# Altium schematic sheet BMC096C.schdoc (part 3 of 3)
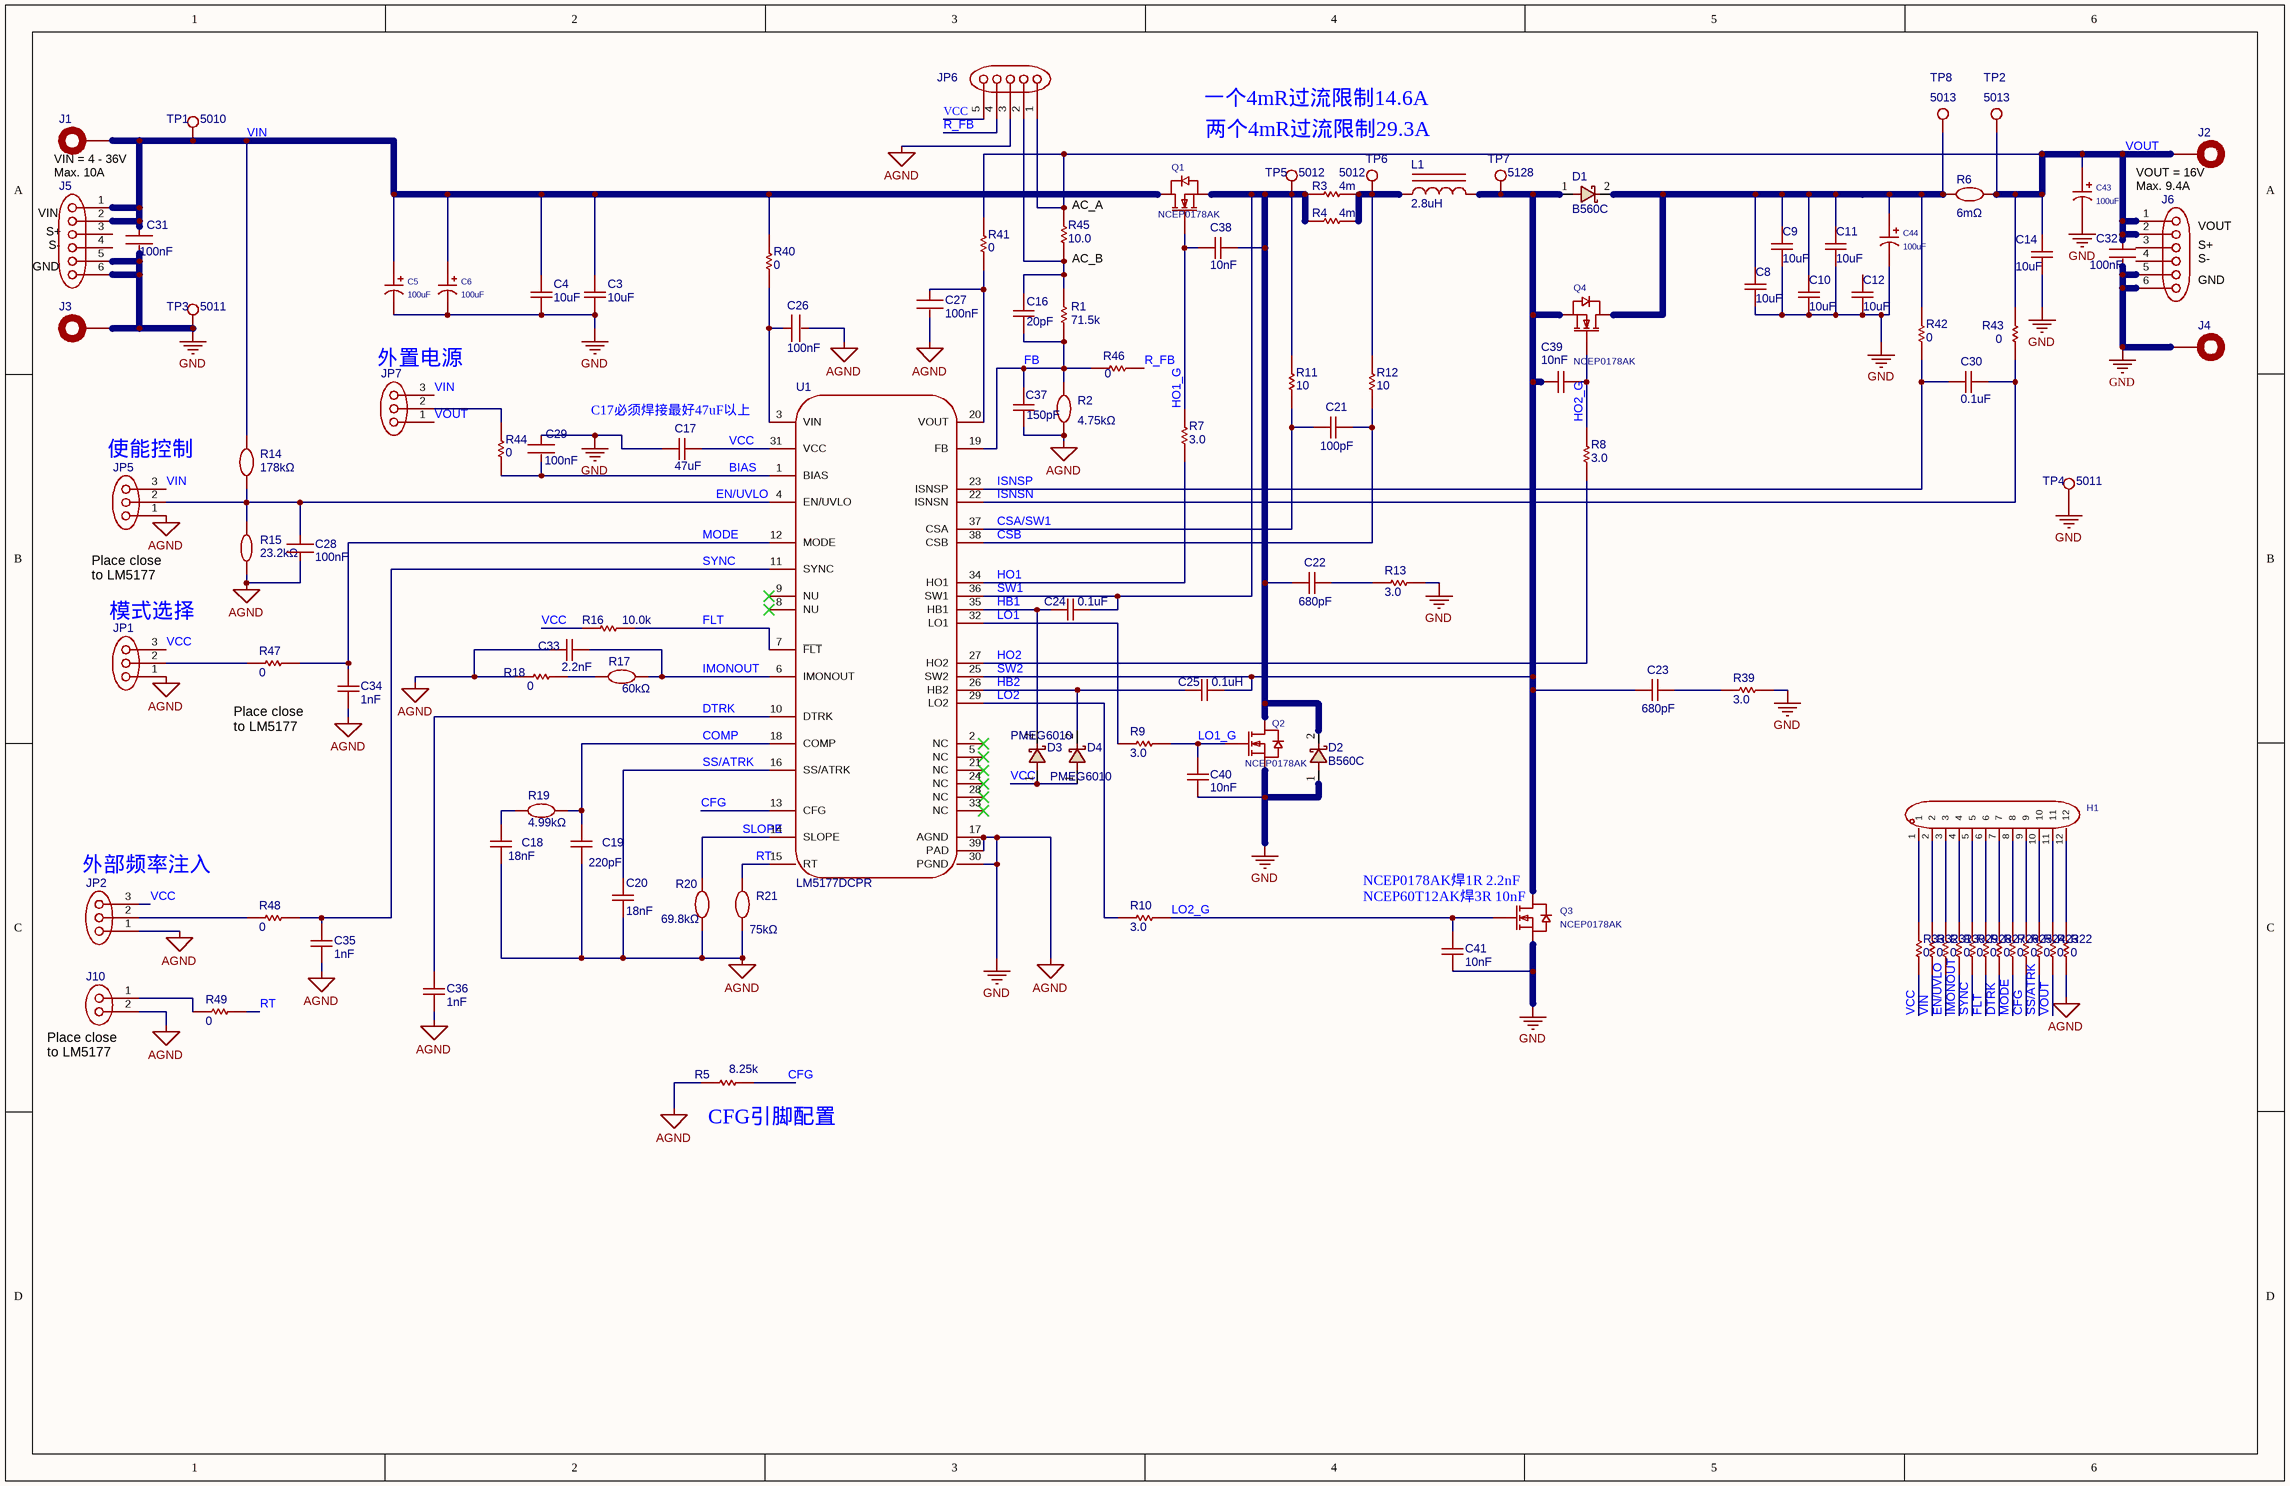
[diagram p2: BMC096C.schdoc]

## Library data of the parts (continued)
R2 = ERJ3EKF4751V: 电阻类型:厚膜电阻;阻值:4.75kΩ;精度:±1%;功率:100mW;工作电压:75V;温度系数:±100ppm/℃;; Manufacturer: PANASONIC(松下); Add into BOM: yes; 3D Model: fc143cca1e79419f9cd78b61e9279f08; 3D Model Transform: 31.8897,63.7794,0,90,0,0,0,0,0; Tolerance: ±1%; Power(Watts): 100mW; Voltage-Supply(Max): 75V; ModelName: R0603; Symbol: ERJ3EKF4751V; Device: ERJ3EKF4751V; Convert to PCB: yes; Value: 4.75kΩ; LCSC Part Name: 厚膜电阻 4.75kΩ ±1% 100mW; Supplier Part: C403242; Manufacturer Part: ERJ3EKF4751V; Supplier Footprint: 0603; JLCPCB Part Class: Extended Part; Datasheet: https://item.szlcsc.com/datasheet/ERJ3EKF4751V/389041.html; Supplier: LCSC; Type: 厚膜电阻; Temperature Coefficient: ±100ppm/℃; Operating Temperature: -55℃~+155℃; FootprintName: R0603
R3 = CMP-0090660-1: 4 mOhms -1% 1W Chip Resistor Wide 0805 (2012 Metric), 0508 Automotive AEC-Q200, Current Sense Metal Foil; Manufacturer: Susumu; AEC Grade: Grade 0; TempCo: 50ppm/癈; SizeZ_mm: 0.7mm; AEC Qualified: Yes; Tolerance_%: 1%; Origin Footprint: FP-KRL2012E-M-R004-F-T5_2012-IPC_C; OriginFootprint 2: FP-KRL2012E-M-R004-F-T5_2012-IPC_B; OriginFootprint 3: FP-KRL2012E-M-R004-F-T5_2012-IPC_A; UniqueId: fe89d0632cfce75f; OriginModelName: Res_KRL2012E-M-R004-F-T5_2012; Device: CMP-0090660-1; Symbol: CMP-0090660-1; Supplier 1: Digikey; ComponentLink1URL: https://www.susumu.co.jp/common/pdf/n_catalog_partition19_en.pdf?v=20180406; Series: KRL; Supplier Part Number 1: 408-1594-1-ND; ComponentLink1Description: Datasheet; RoHS: TRUE; PartNumber: KRL2012E-M-R004-F-T5; Datasheet Path: datasheets/Res-KRL2012E-M-R004-F-T5.pdf; Digikey Description: RES 0.004 OHM 1W 0805 WIDE; Part Number: KRL2012E-M-R004-F-T5; Supplier 2: Mouser; datasheet: https://www.susumu.co.jp/common/pdf/n_catalog_partition19_en.pdf?v=20180406; Supplier Part Number 2: 754-KRL2012EMR004FT5; helpURL: https://upverter.com/upn/revision/b6c0b371fcd2c6f4/; Mouser Description: Current Sense Resistors 0805(Long Side 0508) 1.0W 0.004 Ohm 1% 50Ppm; Lead Free: Yes; Operating Temperature Range: -55癈 to +155癈; Technology: Metal Foil; Digikey Part Number: 408-1594-1-ND; Res_ohm: 4m; PackageReference: 2012; Mouser Part Number: 754-KRL2012EMR004FT5; Power_W: 1W; DesignItemID: CMP-0090660-1; LibraryName: Altium Vault - TI; FootprintName: FP-KRL2012E-M-R004-F-T5_2012-MFG; AddInBom: yes
R4 = CMP-0090660-1: 4 mOhms -1% 1W Chip Resistor Wide 0805 (2012 Metric), 0508 Automotive AEC-Q200, Current Sense Metal Foil; Manufacturer: Susumu; AEC Grade: Grade 0; TempCo: 50ppm/癈; SizeZ_mm: 0.7mm; AEC Qualified: Yes; Tolerance_%: 1%; Origin Footprint: FP-KRL2012E-M-R004-F-T5_2012-IPC_C; OriginFootprint 2: FP-KRL2012E-M-R004-F-T5_2012-IPC_B; OriginFootprint 3: FP-KRL2012E-M-R004-F-T5_2012-IPC_A; UniqueId: fdc86a4b576d9e98; OriginModelName: Res_KRL2012E-M-R004-F-T5_2012; Device: CMP-0090660-1; Symbol: CMP-0090660-1; Supplier 1: Digikey; ComponentLink1URL: https://www.susumu.co.jp/common/pdf/n_catalog_partition19_en.pdf?v=20180406; Series: KRL; Supplier Part Number 1: 408-1594-1-ND; ComponentLink1Description: Datasheet; RoHS: TRUE; PartNumber: KRL2012E-M-R004-F-T5; Datasheet Path: datasheets/Res-KRL2012E-M-R004-F-T5.pdf; Digikey Description: RES 0.004 OHM 1W 0805 WIDE; Part Number: KRL2012E-M-R004-F-T5; Supplier 2: Mouser; datasheet: https://www.susumu.co.jp/common/pdf/n_catalog_partition19_en.pdf?v=20180406; Supplier Part Number 2: 754-KRL2012EMR004FT5; helpURL: https://upverter.com/upn/revision/b6c0b371fcd2c6f4/; Mouser Description: Current Sense Resistors 0805(Long Side 0508) 1.0W 0.004 Ohm 1% 50Ppm; Lead Free: Yes; Operating Temperature Range: -55癈 to +155癈; Technology: Metal Foil; Digikey Part Number: 408-1594-1-ND; Res_ohm: 4m; PackageReference: 2012; Mouser Part Number: 754-KRL2012EMR004FT5; Power_W: 1W; DesignItemID: CMP-0090660-1; LibraryName: Altium Vault - TI; FootprintName: FP-KRL2012E-M-R004-F-T5_2012-MFG; AddInBom: yes
R5 = CMP-0023307-5: RES, 8.25 k, 1%, 0.1 W, 0603; Manufacturer: Yageo; Power_W: 100mW; TempCo: 100 ppm/C; Value_Code: 8k25; Value: 8.25k; EIA_Code: E96; SizeX_mm: 1.6; SizeY_mm: 0.8; SizeZ_mm: 1; Value2: 0.1W; SizeArea_mm2: 1.28; CompType: Resistor; AEC Qualified: N; VDC_V: 75V; AEC Category: Q200; SizeAreaWB_mm2: 4.68; Origin Footprint: 0603; OriginFootprint 2: 0603_HV; OriginFootprint 3: 0603L; OriginFootprint 4: 0603M; AddInBom: yes; Symbol: CMP-0023307-5; Device: CMP-0023307-5; Supplier Part Number 2: 603-RC0603FR-078K25L; Supplier 2: Mouser; Supplier Part Number 3: 9238590; Supplier 3: Farnell; RoHS: Y; Value1: 1%; MountType: SMT; Supplier 1: Digi-Key; PackageReference: 0603; Tolerance_%: 1%; Res_ohm: 8.25k; PartNumber: RC0603FR-078K25L; ComponentLink1Description: Datasheet link; Supplier Part Number 1: 311-8.25KHRCT-ND; Technology: Thick Film; ComponentLink1URL: http://www.yageo.com/pdf/Pu-RC0603_51_PbFree_L_2.pdf; AEC Grade: N/A; DesignItemID: CMP-0023307-5; LibraryName: Altium Vault - TI; FootprintName: 0603S
R6 = JER2512F3R006: 电阻类型:采样电阻；合金电阻;阻值:6mΩ;精度:±1%;功率:3W;温度系数:±50ppm/℃;安装方式:贴片;; Manufacturer: JIERR(捷而瑞); Add into BOM: yes; 3D Model: 3c946b39f1b547de9af067cb1ede82cc; 3D Model Transform: 252.7554,126.7714,0,0,0,0,0,0,0; Tolerance: ±1%; Power(Watts): 3W; ModelName: RES-SMD_L6.4-W3.2-R2512; Symbol: JER2512F3R006; Device: JER2512F3R006; Convert to PCB: yes; Value: 6mΩ; LCSC Part Name: 6mΩ 3W 2512 ±1%; Supplier Part: C46634449; Manufacturer Part: JER2512F3R006; Supplier Footprint: 2512; JLCPCB Part Class: Extended Part; Datasheet: https://item.szlcsc.com/datasheet/JER2512F3R006/48788251.html; Supplier: LCSC; Type: 采样电阻；合金电阻; Temperature Coefficient: ±50ppm/℃; Mounting Type: 贴片; FootprintName: RES-SMD_L6.4-W3.2-R2512
R7 = CMP-0025804-4: RES, 3.0, 5%, 0.1 W, AEC-Q200 Grade 0, 0603; Manufacturer: Vishay-Dale; Power_W: 100mW; TempCo: 200 ppm/C; Value_Code: 3R00; Value: 3.0; EIA_Code: E24; Res_ohm: 3; SizeX_mm: 1.6; SizeY_mm: 0.8; SizeZ_mm: 1; Value2: 0.1W; SizeArea_mm2: 1.28; CompType: Resistor; AEC Qualified: Y; VDC_V: 75V; AEC Category: Q200; AEC Grade: 0; Origin Footprint: 0603; OriginFootprint 2: 0603_HV; OriginFootprint 3: 0603L; OriginFootprint 4: 0603M; UniqueId: ba2c6d155e7fd301; AddInBom: yes; Device: CMP-0025804-4; Symbol: CMP-0025804-4; Supplier Part Number 2: 47P3561; Supplier 2: Newark; Supplier Part Number 3: 71-CRCW0603J-3-E3; Supplier 3: Mouser; RoHS: E; Value1: 5%; MountType: SMT; Supplier 1: Digi-Key; PackageReference: 0603; Tolerance_%: 5%; PartNumber: CRCW06033R00JNEA; ComponentLink1Description: Datasheet link; Supplier Part Number 1: 541-3.0GCT-ND; Technology: Thick Film; ComponentLink1URL: http://www.vishay.com/docs/20035/dcrcwe3.pdf; DesignItemID: CMP-0025804-4; LibraryName: Altium Vault - TI; FootprintName: 0603S
R8 = CMP-0025804-4: RES, 3.0, 5%, 0.1 W, AEC-Q200 Grade 0, 0603; Manufacturer: Vishay-Dale; Power_W: 100mW; TempCo: 200 ppm/C; Value_Code: 3R00; Value: 3.0; EIA_Code: E24; Res_ohm: 3; SizeX_mm: 1.6; SizeY_mm: 0.8; SizeZ_mm: 1; Value2: 0.1W; SizeArea_mm2: 1.28; CompType: Resistor; AEC Qualified: Y; VDC_V: 75V; AEC Category: Q200; AEC Grade: 0; Origin Footprint: 0603; OriginFootprint 2: 0603_HV; OriginFootprint 3: 0603L; OriginFootprint 4: 0603M; UniqueId: 86d447fa2a9c8586; AddInBom: yes; Device: CMP-0025804-4; Symbol: CMP-0025804-4; Supplier Part Number 2: 47P3561; Supplier 2: Newark; Supplier Part Number 3: 71-CRCW0603J-3-E3; Supplier 3: Mouser; RoHS: E; Value1: 5%; MountType: SMT; Supplier 1: Digi-Key; PackageReference: 0603; Tolerance_%: 5%; PartNumber: CRCW06033R00JNEA; ComponentLink1Description: Datasheet link; Supplier Part Number 1: 541-3.0GCT-ND; Technology: Thick Film; ComponentLink1URL: http://www.vishay.com/docs/20035/dcrcwe3.pdf; DesignItemID: CMP-0025804-4; LibraryName: Altium Vault - TI; FootprintName: 0603S
R9 = CMP-0025804-4: RES, 3.0, 5%, 0.1 W, AEC-Q200 Grade 0, 0603; Manufacturer: Vishay-Dale; Power_W: 100mW; TempCo: 200 ppm/C; Value_Code: 3R00; Value: 3.0; EIA_Code: E24; Res_ohm: 3; SizeX_mm: 1.6; SizeY_mm: 0.8; SizeZ_mm: 1; Value2: 0.1W; SizeArea_mm2: 1.28; CompType: Resistor; AEC Qualified: Y; VDC_V: 75V; AEC Category: Q200; AEC Grade: 0; Origin Footprint: 0603; OriginFootprint 2: 0603_HV; OriginFootprint 3: 0603L; OriginFootprint 4: 0603M; UniqueId: 1e1ffada38203b9e; AddInBom: yes; Device: CMP-0025804-4; Symbol: CMP-0025804-4; Supplier Part Number 2: 47P3561; Supplier 2: Newark; Supplier Part Number 3: 71-CRCW0603J-3-E3; Supplier 3: Mouser; RoHS: E; Value1: 5%; MountType: SMT; Supplier 1: Digi-Key; PackageReference: 0603; Tolerance_%: 5%; PartNumber: CRCW06033R00JNEA; ComponentLink1Description: Datasheet link; Supplier Part Number 1: 541-3.0GCT-ND; Technology: Thick Film; ComponentLink1URL: http://www.vishay.com/docs/20035/dcrcwe3.pdf; DesignItemID: CMP-0025804-4; LibraryName: Altium Vault - TI; FootprintName: 0603S
R10 = CMP-0025804-4: RES, 3.0, 5%, 0.1 W, AEC-Q200 Grade 0, 0603; Manufacturer: Vishay-Dale; Power_W: 100mW; TempCo: 200 ppm/C; Value_Code: 3R00; Value: 3.0; EIA_Code: E24; Res_ohm: 3; SizeX_mm: 1.6; SizeY_mm: 0.8; SizeZ_mm: 1; Value2: 0.1W; SizeArea_mm2: 1.28; CompType: Resistor; AEC Qualified: Y; VDC_V: 75V; AEC Category: Q200; AEC Grade: 0; Origin Footprint: 0603; OriginFootprint 2: 0603_HV; OriginFootprint 3: 0603L; OriginFootprint 4: 0603M; UniqueId: 41bc0941336b1513; AddInBom: yes; Device: CMP-0025804-4; Symbol: CMP-0025804-4; Supplier Part Number 2: 47P3561; Supplier 2: Newark; Supplier Part Number 3: 71-CRCW0603J-3-E3; Supplier 3: Mouser; RoHS: E; Value1: 5%; MountType: SMT; Supplier 1: Digi-Key; PackageReference: 0603; Tolerance_%: 5%; PartNumber: CRCW06033R00JNEA; ComponentLink1Description: Datasheet link; Supplier Part Number 1: 541-3.0GCT-ND; Technology: Thick Film; ComponentLink1URL: http://www.vishay.com/docs/20035/dcrcwe3.pdf; DesignItemID: CMP-0025804-4; LibraryName: Altium Vault - TI; FootprintName: 0603S
R11 = CMP-0084243-1: RES, 100, 1%, 0.25 W, AEC-Q200 Grade 0, 0603; Manufacturer: Vishay-Dale; Power_W: 250mW; TempCo: 100 ppm/C; SizeAreaWB_mm2: 4.68; Value_Code: 100R; Value: 100; EIA_Code: E96; SizeX_mm: 1.6; SizeY_mm: 0.8; SizeZ_mm: 1; Value2: 0.25W; SizeArea_mm2: 1.28; CompType: Resistor; AEC Qualified: Y; AEC Grade: 0; AEC Category: Q200; Origin Footprint: 0603; OriginFootprint 2: 0603M; OriginFootprint 3: 0603L; OriginFootprint 4: 0603_HV; UniqueId: 763cf8d5648cb4fd; AddInBom: yes; Device: CMP-0084243-1; Symbol: CMP-0084243-1; ComponentLink1URL: http://www.vishay.com/docs/20043/crcwhpe3.pdf; RoHS: Y; Value1: 1%; MountType: SMT; PackageReference: 0603; Tolerance_%: 1%; Res_ohm: 100; PartNumber: CRCW0603100RFKEAHP; ComponentLink1Description: Datasheet link; Technology: Thick Film; DesignItemID: CMP-0084243-1; LibraryName: Altium Vault - TI; FootprintName: 0603S
R12 = CMP-0084243-1: RES, 100, 1%, 0.25 W, AEC-Q200 Grade 0, 0603; Manufacturer: Vishay-Dale; Power_W: 250mW; TempCo: 100 ppm/C; SizeAreaWB_mm2: 4.68; Value_Code: 100R; Value: 100; EIA_Code: E96; SizeX_mm: 1.6; SizeY_mm: 0.8; SizeZ_mm: 1; Value2: 0.25W; SizeArea_mm2: 1.28; CompType: Resistor; AEC Qualified: Y; AEC Grade: 0; AEC Category: Q200; Origin Footprint: 0603; OriginFootprint 2: 0603M; OriginFootprint 3: 0603L; OriginFootprint 4: 0603_HV; UniqueId: 15ac9218146e0f4b; AddInBom: yes; Device: CMP-0084243-1; Symbol: CMP-0084243-1; ComponentLink1URL: http://www.vishay.com/docs/20043/crcwhpe3.pdf; RoHS: Y; Value1: 1%; MountType: SMT; PackageReference: 0603; Tolerance_%: 1%; Res_ohm: 100; PartNumber: CRCW0603100RFKEAHP; ComponentLink1Description: Datasheet link; Technology: Thick Film; DesignItemID: CMP-0084243-1; LibraryName: Altium Vault - TI; FootprintName: 0603S
R13 = CMP-0025804-4: RES, 3.0, 5%, 0.1 W, AEC-Q200 Grade 0, 0603; Manufacturer: Vishay-Dale; Power_W: 100mW; TempCo: 200 ppm/C; Value_Code: 3R00; Value: 3.0; EIA_Code: E24; Res_ohm: 3; SizeX_mm: 1.6; SizeY_mm: 0.8; SizeZ_mm: 1; Value2: 0.1W; SizeArea_mm2: 1.28; CompType: Resistor; AEC Qualified: Y; VDC_V: 75V; AEC Category: Q200; AEC Grade: 0; Origin Footprint: 0603; OriginFootprint 2: 0603_HV; OriginFootprint 3: 0603L; OriginFootprint 4: 0603M; UniqueId: ff4077a9ca69db92; AddInBom: yes; Device: CMP-0025804-4; Symbol: CMP-0025804-4; Supplier Part Number 2: 47P3561; Supplier 2: Newark; Supplier Part Number 3: 71-CRCW0603J-3-E3; Supplier 3: Mouser; RoHS: E; Value1: 5%; MountType: SMT; Supplier 1: Digi-Key; PackageReference: 0603; Tolerance_%: 5%; PartNumber: CRCW06033R00JNEA; ComponentLink1Description: Datasheet link; Supplier Part Number 1: 541-3.0GCT-ND; Technology: Thick Film; ComponentLink1URL: http://www.vishay.com/docs/20035/dcrcwe3.pdf; DesignItemID: CMP-0025804-4; LibraryName: Altium Vault - TI; FootprintName: 0603S
R14 = FRC0603F1783TS: 电阻类型:厚膜电阻;阻值:178kΩ;精度:±1%;功率:100mW;工作电压:75V;温度系数:±100ppm/℃;; Manufacturer: FOJAN(富捷); Add into BOM: yes; 3D Model: fc143cca1e79419f9cd78b61e9279f08; 3D Model Transform: 31.8897,63.7794,0,90,0,0,0,0,0; Tolerance: ±1%; Power(Watts): 100mW; Voltage-Supply(Max): 75V; ModelName: R0603; Symbol: FRC0603F1783TS; Device: FRC0603F1783TS; Convert to PCB: yes; Value: 178kΩ; LCSC Part Name: 厚膜电阻 178kΩ ±1% 100mW; Supplier Part: C48533690; Manufacturer Part: FRC0603F1783TS; Supplier Footprint: 0603; JLCPCB Part Class: Extended Part; Datasheet: https://item.szlcsc.com/datasheet/FRC0603F1783TS/50792254.html; Supplier: LCSC; Type: 厚膜电阻; Temperature Coefficient: ±100ppm/℃; Operating Temperature: -55℃~+155℃; FootprintName: R0603
R15 = 0603WAF2322T5E: 电阻类型:厚膜电阻;阻值:23.2kΩ;精度:±1%;功率:100mW;工作电压:75V;温度系数:±100ppm/℃;; Manufacturer: UNI-ROYAL(厚声); Add into BOM: yes; 3D Model: fc143cca1e79419f9cd78b61e9279f08; 3D Model Transform: 31.8897,63.7794,0,90,0,0,0,0,0; Tolerance: ±1%; Power(Watts): 100mW; Voltage-Supply(Max): 75V; ModelName: R0603; Symbol: 0603WAF2322T5E; Device: 0603WAF2322T5E; Convert to PCB: yes; Value: 23.2kΩ; LCSC Part Name: 23.2kΩ ±1% 100mW 厚膜电阻; Supplier Part: C23346; Manufacturer Part: 0603WAF2322T5E; Supplier Footprint: 0603; JLCPCB Part Class: Extended Part; Datasheet: https://item.szlcsc.com/datasheet/0603WAF2322T5E/24079.html; Supplier: LCSC; Type: 厚膜电阻; Temperature Coefficient: ±100ppm/℃; Operating Temperature: -55℃~+155℃; FootprintName: R0603
R16 = CMP-0023653-3: RES, 10.0 k, 0.1%, 0.1 W, 0603; Manufacturer: Yageo America; Power_W: 100mW; TempCo: 25 ppm/C; Value_Code: 10k0; U/M: EA; Value: 10.0k; EIA_Code: E192; Res_ohm: 10k; SizeX_mm: 1.6; SizeY_mm: 0.8; SizeZ_mm: 1; Value2: 0.1W; SizeArea_mm2: 1.28; CompType: Resistor; VDC_V: 75V; AEC Category: Q200; Origin Footprint: 0603; OriginFootprint 2: 0603_HV; OriginFootprint 3: 0603L; OriginFootprint 4: 0603M; UniqueId: 3c543c7c58e1cc80; AddInBom: yes; Device: CMP-0023653-3; Symbol: CMP-0023653-3; Publisher: Texas Instruments; Published: 2008-06-26; RoHS: Y; Value1: 0.1%; MountType: SMT; PackageReference: 0603; Tolerance_%: 0.1%; LatestRevisionDate: 2017-03-09; PartNumber: RT0603BRD0710KL; AEC Qualified: ?; ComponentLink1Description: Datasheet link; Technology: Thin Film; ComponentLink1URL: http://www.yageo.com/pdf/PYu-RT_1-to-0.05_RoHS_L_3.pdf; DesignItemID: CMP-0023653-3; LibraryName: Altium Vault - TI; FootprintName: 0603S
R17 = RT0603BRD0760KL: 电阻类型:薄膜电阻;阻值:60kΩ;精度:±0.1%;功率:100mW;工作电压:75V;温度系数:±25ppm/℃;; Manufacturer: YAGEO(国巨); Add into BOM: yes; 3D Model: 23cb0422d2aa44048b6e6e3bc21a96b9; 3D Model Transform: 61.024,33.504,0,0,0,0,0,0,0; Tolerance: ±0.1%; Power(Watts): 100mW; Voltage-Supply(Max): 75V; ModelName: RES-SMD_L1.55-W0.85; Symbol: RT0603BRD0760KL; Device: RT0603BRD0760KL; Convert to PCB: yes; Value: 60kΩ; LCSC Part Name: 薄膜电阻 60kΩ ±0.1% 100mW; Supplier Part: C6460576; Manufacturer Part: RT0603BRD0760KL; Supplier Footprint: 0603; JLCPCB Part Class: Extended Part; Datasheet: https://item.szlcsc.com/datasheet/RT0603BRD0760KL/7413753.html; Supplier: LCSC; Type: 薄膜电阻; Temperature Coefficient: ±25ppm/℃; Operating Temperature: -55℃~+155℃; FootprintName: RES-SMD_L1.55-W0.85
R18 R22-R33 R48 = CMP-0023343-3: RES, 0, 1%, 0.1 W, AEC-Q200 Grade 0, 0603; Manufacturer: Stackpole Electronics Inc; Power_W: 100mW; TempCo: ppm/C; U/M: EA; Value: 0; SizeX_mm: 1.6; SizeY_mm: 0.8; SizeZ_mm: 1; Value2: 0.1W; SizeArea_mm2: 1.28; CompType: Resistor; AEC Qualified: Y; AEC Category: Q200; Origin Footprint: 0603; OriginFootprint 2: 0603_HV; OriginFootprint 3: 0603L; OriginFootprint 4: 0603M; AddInBom: yes; Device: CMP-0023343-3; Symbol: CMP-0023343-3; Publisher: Texas Instruments; Published: 2008-06-26; Value_Code: 0; RoHS: Y; Value1: 1%; MountType: SMT; Supplier 1: Digi-Key; PackageReference: 0603; Tolerance_%: 1%; Res_ohm: 0; LatestRevisionDate: 2017-03-09; PartNumber: RMCF0603ZT0R00; ComponentLink1Description: Datasheet link; AEC Grade: 0; Supplier Part Number 1: RMCF0603ZT0R00CT-ND; Technology: Thick Film; ComponentLink1URL: https://www.seielect.com/Catalog/SEI-RMCF_RMCP.pdf; DesignItemID: CMP-0023343-3; LibraryName: Altium Vault - TI; FootprintName: 0603S
R19 = FRC0603F4991TS: 电阻类型:厚膜电阻;阻值:4.99kΩ;精度:±1%;功率:100mW;工作电压:75V;温度系数:±100ppm/℃;; Manufacturer: FOJAN(富捷); Add into BOM: yes; 3D Model: fc143cca1e79419f9cd78b61e9279f08; 3D Model Transform: 31.8897,63.7794,0,90,0,0,0,0,0; Tolerance: ±1%; Power(Watts): 100mW; Voltage-Supply(Max): 75V; ModelName: R0603; Symbol: FRC0603F4991TS; Device: FRC0603F4991TS; Convert to PCB: yes; Value: 4.99kΩ; LCSC Part Name: 4.99kΩ ±1% 100mW 厚膜电阻; Supplier Part: C2933228; Manufacturer Part: FRC0603F4991TS; Supplier Footprint: 0603; JLCPCB Part Class: Extended Part; Datasheet: https://item.szlcsc.com/datasheet/FRC0603F4991TS/3279330.html; Supplier: LCSC; Type: 厚膜电阻; Temperature Coefficient: ±100ppm/℃; Operating Temperature: -55℃~+155℃; FootprintName: R0603
R20 = FRC0603F6982TS: 电阻类型:厚膜电阻;阻值:69.8kΩ;精度:±1%;功率:100mW;工作电压:75V;温度系数:±100ppm/℃;; Manufacturer: FOJAN(富捷); Add into BOM: yes; 3D Model: fc143cca1e79419f9cd78b61e9279f08; 3D Model Transform: 31.8897,63.7794,0,90,0,0,0,0,0; Tolerance: ±1%; Power(Watts): 100mW; Voltage-Supply(Max): 75V; ModelName: R0603; Symbol: FRC0603F6982TS; Device: FRC0603F6982TS; Convert to PCB: yes; Value: 69.8kΩ; LCSC Part Name: 69.8kΩ ±1% 100mW 厚膜电阻; Supplier Part: C2930012; Manufacturer Part: FRC0603F6982TS; Supplier Footprint: 0603; JLCPCB Part Class: Extended Part; Datasheet: https://item.szlcsc.com/datasheet/FRC0603F6982TS/3266945.html; Supplier: LCSC; Type: 厚膜电阻; Temperature Coefficient: ±100ppm/℃; Operating Temperature: -55℃~+155℃; FootprintName: R0603
R21 = FRC0603F7502TS: 电阻类型:厚膜电阻;阻值:75kΩ;精度:±1%;功率:100mW;工作电压:75V;温度系数:±100ppm/℃;; Manufacturer: FOJAN(富捷); Add into BOM: yes; 3D Model: fc143cca1e79419f9cd78b61e9279f08; 3D Model Transform: 31.8897,63.7794,0,90,0,0,0,0,0; Tolerance: ±1%; Power(Watts): 100mW; Voltage-Supply(Max): 75V; ModelName: R0603; Symbol: FRC0603F7502TS; Device: FRC0603F7502TS; Convert to PCB: yes; Value: 75kΩ; LCSC Part Name: 75kΩ ±1% 100mW 厚膜电阻; Supplier Part: C2907067; Manufacturer Part: FRC0603F7502TS; Supplier Footprint: 0603; JLCPCB Part Class: Extended Part; Supplier: LCSC; Type: 厚膜电阻; Temperature Coefficient: ±100ppm/℃; Operating Temperature: -55℃~+155℃; FootprintName: R0603
R39 = CMP-0025804-4: RES, 3.0, 5%, 0.1 W, AEC-Q200 Grade 0, 0603; Manufacturer: Vishay-Dale; Power_W: 100mW; TempCo: 200 ppm/C; Value_Code: 3R00; Value: 3.0; EIA_Code: E24; Res_ohm: 3; SizeX_mm: 1.6; SizeY_mm: 0.8; SizeZ_mm: 1; Value2: 0.1W; SizeArea_mm2: 1.28; CompType: Resistor; AEC Qualified: Y; VDC_V: 75V; AEC Category: Q200; AEC Grade: 0; Origin Footprint: 0603; OriginFootprint 2: 0603_HV; OriginFootprint 3: 0603L; OriginFootprint 4: 0603M; UniqueId: 61aee2c7162d13e5; AddInBom: yes; Device: CMP-0025804-4; Symbol: CMP-0025804-4; Supplier Part Number 2: 47P3561; Supplier 2: Newark; Supplier Part Number 3: 71-CRCW0603J-3-E3; Supplier 3: Mouser; RoHS: E; Value1: 5%; MountType: SMT; Supplier 1: Digi-Key; PackageReference: 0603; Tolerance_%: 5%; PartNumber: CRCW06033R00JNEA; ComponentLink1Description: Datasheet link; Supplier Part Number 1: 541-3.0GCT-ND; Technology: Thick Film; ComponentLink1URL: http://www.vishay.com/docs/20035/dcrcwe3.pdf; DesignItemID: CMP-0025804-4; LibraryName: Altium Vault - TI; FootprintName: 0603S
R40 = CMP-0023343-3: RES, 0, 1%, 0.1 W, AEC-Q200 Grade 0, 0603; Manufacturer: Stackpole Electronics Inc; Power_W: 100mW; TempCo: ppm/C; U/M: EA; Value: 0; SizeX_mm: 1.6; SizeY_mm: 0.8; SizeZ_mm: 1; Value2: 0.1W; SizeArea_mm2: 1.28; CompType: Resistor; AEC Qualified: Y; AEC Category: Q200; Origin Footprint: 0603; OriginFootprint 2: 0603_HV; OriginFootprint 3: 0603L; OriginFootprint 4: 0603M; UniqueId: 5d7d37af6db8001c; AddInBom: yes; Device: CMP-0023343-3; Symbol: CMP-0023343-3; Publisher: Texas Instruments; Published: 2008-06-26; Value_Code: 0; RoHS: Y; Value1: 1%; MountType: SMT; Supplier 1: Digi-Key; PackageReference: 0603; Tolerance_%: 1%; Res_ohm: 0; LatestRevisionDate: 2017-03-09; PartNumber: RMCF0603ZT0R00; ComponentLink1Description: Datasheet link; AEC Grade: 0; Supplier Part Number 1: RMCF0603ZT0R00CT-ND; Technology: Thick Film; ComponentLink1URL: https://www.seielect.com/Catalog/SEI-RMCF_RMCP.pdf; DesignItemID: CMP-0023343-3; LibraryName: Altium Vault - TI; FootprintName: 0603S
R41 = CMP-0023343-3: RES, 0, 1%, 0.1 W, AEC-Q200 Grade 0, 0603; Manufacturer: Stackpole Electronics Inc; Power_W: 100mW; TempCo: ppm/C; U/M: EA; Value: 0; SizeX_mm: 1.6; SizeY_mm: 0.8; SizeZ_mm: 1; Value2: 0.1W; SizeArea_mm2: 1.28; CompType: Resistor; AEC Qualified: Y; AEC Category: Q200; Origin Footprint: 0603; OriginFootprint 2: 0603_HV; OriginFootprint 3: 0603L; OriginFootprint 4: 0603M; UniqueId: e262797b4e338b99; AddInBom: yes; Device: CMP-0023343-3; Symbol: CMP-0023343-3; Publisher: Texas Instruments; Published: 2008-06-26; Value_Code: 0; RoHS: Y; Value1: 1%; MountType: SMT; Supplier 1: Digi-Key; PackageReference: 0603; Tolerance_%: 1%; Res_ohm: 0; LatestRevisionDate: 2017-03-09; PartNumber: RMCF0603ZT0R00; ComponentLink1Description: Datasheet link; AEC Grade: 0; Supplier Part Number 1: RMCF0603ZT0R00CT-ND; Technology: Thick Film; ComponentLink1URL: https://www.seielect.com/Catalog/SEI-RMCF_RMCP.pdf; DesignItemID: CMP-0023343-3; LibraryName: Altium Vault - TI; FootprintName: 0603S
R42 = CMP-0023343-3: RES, 0, 1%, 0.1 W, AEC-Q200 Grade 0, 0603; Manufacturer: Stackpole Electronics Inc; Power_W: 100mW; TempCo: ppm/C; U/M: EA; Value: 0; SizeX_mm: 1.6; SizeY_mm: 0.8; SizeZ_mm: 1; Value2: 0.1W; SizeArea_mm2: 1.28; CompType: Resistor; AEC Qualified: Y; AEC Category: Q200; Origin Footprint: 0603; OriginFootprint 2: 0603_HV; OriginFootprint 3: 0603L; OriginFootprint 4: 0603M; UniqueId: 3520350cb8a16ddf; AddInBom: yes; Device: CMP-0023343-3; Symbol: CMP-0023343-3; Publisher: Texas Instruments; Published: 2008-06-26; Value_Code: 0; RoHS: Y; Value1: 1%; MountType: SMT; Supplier 1: Digi-Key; PackageReference: 0603; Tolerance_%: 1%; Res_ohm: 0; LatestRevisionDate: 2017-03-09; PartNumber: RMCF0603ZT0R00; ComponentLink1Description: Datasheet link; AEC Grade: 0; Supplier Part Number 1: RMCF0603ZT0R00CT-ND; Technology: Thick Film; ComponentLink1URL: https://www.seielect.com/Catalog/SEI-RMCF_RMCP.pdf; DesignItemID: CMP-0023343-3; LibraryName: Altium Vault - TI; FootprintName: 0603S
R43 = CMP-0023343-3: RES, 0, 1%, 0.1 W, AEC-Q200 Grade 0, 0603; Manufacturer: Stackpole Electronics Inc; Power_W: 100mW; TempCo: ppm/C; U/M: EA; Value: 0; SizeX_mm: 1.6; SizeY_mm: 0.8; SizeZ_mm: 1; Value2: 0.1W; SizeArea_mm2: 1.28; CompType: Resistor; AEC Qualified: Y; AEC Category: Q200; Origin Footprint: 0603; OriginFootprint 2: 0603_HV; OriginFootprint 3: 0603L; OriginFootprint 4: 0603M; UniqueId: 1ad54b734ffff27e; AddInBom: yes; Device: CMP-0023343-3; Symbol: CMP-0023343-3; Publisher: Texas Instruments; Published: 2008-06-26; Value_Code: 0; RoHS: Y; Value1: 1%; MountType: SMT; Supplier 1: Digi-Key; PackageReference: 0603; Tolerance_%: 1%; Res_ohm: 0; LatestRevisionDate: 2017-03-09; PartNumber: RMCF0603ZT0R00; ComponentLink1Description: Datasheet link; AEC Grade: 0; Supplier Part Number 1: RMCF0603ZT0R00CT-ND; Technology: Thick Film; ComponentLink1URL: https://www.seielect.com/Catalog/SEI-RMCF_RMCP.pdf; DesignItemID: CMP-0023343-3; LibraryName: Altium Vault - TI; FootprintName: 0603S
R44 = CMP-0023343-3: RES, 0, 1%, 0.1 W, AEC-Q200 Grade 0, 0603; Manufacturer: Stackpole Electronics Inc; Power_W: 100mW; TempCo: ppm/C; U/M: EA; Value: 0; SizeX_mm: 1.6; SizeY_mm: 0.8; SizeZ_mm: 1; Value2: 0.1W; SizeArea_mm2: 1.28; CompType: Resistor; AEC Qualified: Y; AEC Category: Q200; Origin Footprint: 0603; OriginFootprint 2: 0603_HV; OriginFootprint 3: 0603L; OriginFootprint 4: 0603M; UniqueId: 3f1747bc7cd0165c; AddInBom: yes; Device: CMP-0023343-3; Symbol: CMP-0023343-3; Publisher: Texas Instruments; Published: 2008-06-26; Value_Code: 0; RoHS: Y; Value1: 1%; MountType: SMT; Supplier 1: Digi-Key; PackageReference: 0603; Tolerance_%: 1%; Res_ohm: 0; LatestRevisionDate: 2017-03-09; PartNumber: RMCF0603ZT0R00; ComponentLink1Description: Datasheet link; AEC Grade: 0; Supplier Part Number 1: RMCF0603ZT0R00CT-ND; Technology: Thick Film; ComponentLink1URL: https://www.seielect.com/Catalog/SEI-RMCF_RMCP.pdf; DesignItemID: CMP-0023343-3; LibraryName: Altium Vault - TI; FootprintName: 0603S
R45 = CMP-0022751-4: RES, 10.0, 1%, 0.1 W, 0603; Manufacturer: Yageo; Power_W: 100mW; TempCo: 100 ppm/C; Value_Code: 10R0; Value: 10.0; EIA_Code: E96; Res_ohm: 10; SizeX_mm: 1.6; SizeY_mm: 0.8; SizeZ_mm: 1; Value2: 0.1W; SizeArea_mm2: 1.28; CompType: Resistor; AEC Qualified: N; VDC_V: 75V; AEC Category: Q200; SizeAreaWB_mm2: 4.68; Origin Footprint: 0603; OriginFootprint 2: 0603_HV; OriginFootprint 3: 0603L; OriginFootprint 4: 0603M; UniqueId: fe3640da4f52432f; AddInBom: yes; Device: CMP-0022751-4; Symbol: CMP-0022751-4; ComponentLink1URL: http://www.yageo.com/pdf/Pu-RC0603_51_PbFree_L_2.pdf; Supplier Part Number 2: 603-RC0603FR-0710RL; Supplier 2: Mouser; Supplier Part Number 3: 9238247; Supplier 3: Farnell; RoHS: Y; Value1: 1%; MountType: SMT; Supplier 1: Digi-Key; PackageReference: 0603; Tolerance_%: 1%; PartNumber: RC0603FR-0710RL; ComponentLink1Description: Datasheet link; Supplier Part Number 1: 311-10.0HRCT-ND; Technology: Thick Film; AEC Grade: N/A; DesignItemID: CMP-0022751-4; LibraryName: Altium Vault - TI; FootprintName: 0603S
R46 = CMP-0023343-3: RES, 0, 1%, 0.1 W, AEC-Q200 Grade 0, 0603; Manufacturer: Stackpole Electronics Inc; Power_W: 100mW; TempCo: ppm/C; U/M: EA; Value: 0; SizeX_mm: 1.6; SizeY_mm: 0.8; SizeZ_mm: 1; Value2: 0.1W; SizeArea_mm2: 1.28; CompType: Resistor; AEC Qualified: Y; AEC Category: Q200; Origin Footprint: 0603; OriginFootprint 2: 0603_HV; OriginFootprint 3: 0603L; OriginFootprint 4: 0603M; UniqueId: 9e0eccf13a6f31a8; AddInBom: yes; Device: CMP-0023343-3; Symbol: CMP-0023343-3; Publisher: Texas Instruments; Published: 2008-06-26; Value_Code: 0; RoHS: Y; Value1: 1%; MountType: SMT; Supplier 1: Digi-Key; PackageReference: 0603; Tolerance_%: 1%; Res_ohm: 0; LatestRevisionDate: 2017-03-09; PartNumber: RMCF0603ZT0R00; ComponentLink1Description: Datasheet link; AEC Grade: 0; Supplier Part Number 1: RMCF0603ZT0R00CT-ND; Technology: Thick Film; ComponentLink1URL: https://www.seielect.com/Catalog/SEI-RMCF_RMCP.pdf; DesignItemID: CMP-0023343-3; LibraryName: Altium Vault - TI; FootprintName: 0603S
R47 = CMP-0023343-3: RES, 0, 1%, 0.1 W, AEC-Q200 Grade 0, 0603; Manufacturer: Stackpole Electronics Inc; Power_W: 100mW; TempCo: ppm/C; U/M: EA; Value: 0; SizeX_mm: 1.6; SizeY_mm: 0.8; SizeZ_mm: 1; Value2: 0.1W; SizeArea_mm2: 1.28; CompType: Resistor; AEC Qualified: Y; AEC Category: Q200; Origin Footprint: 0603; OriginFootprint 2: 0603_HV; OriginFootprint 3: 0603L; OriginFootprint 4: 0603M; UniqueId: 1887dacec97403d3; AddInBom: yes; Device: CMP-0023343-3; Symbol: CMP-0023343-3; Publisher: Texas Instruments; Published: 2008-06-26; Value_Code: 0; RoHS: Y; Value1: 1%; MountType: SMT; Supplier 1: Digi-Key; PackageReference: 0603; Tolerance_%: 1%; Res_ohm: 0; LatestRevisionDate: 2017-03-09; PartNumber: RMCF0603ZT0R00; ComponentLink1Description: Datasheet link; AEC Grade: 0; Supplier Part Number 1: RMCF0603ZT0R00CT-ND; Technology: Thick Film; ComponentLink1URL: https://www.seielect.com/Catalog/SEI-RMCF_RMCP.pdf; DesignItemID: CMP-0023343-3; LibraryName: Altium Vault - TI; FootprintName: 0603S
R49 = CMP-0023343-3: RES, 0, 1%, 0.1 W, AEC-Q200 Grade 0, 0603; Manufacturer: Stackpole Electronics Inc; Power_W: 100mW; TempCo: ppm/C; U/M: EA; Value: 0; SizeX_mm: 1.6; SizeY_mm: 0.8; SizeZ_mm: 1; Value2: 0.1W; SizeArea_mm2: 1.28; CompType: Resistor; AEC Qualified: Y; AEC Category: Q200; Origin Footprint: 0603; OriginFootprint 2: 0603_HV; OriginFootprint 3: 0603L; OriginFootprint 4: 0603M; UniqueId: 086d1dd8ac2c5fca; AddInBom: yes; Device: CMP-0023343-3; Symbol: CMP-0023343-3; Publisher: Texas Instruments; Published: 2008-06-26; Value_Code: 0; RoHS: Y; Value1: 1%; MountType: SMT; Supplier 1: Digi-Key; PackageReference: 0603; Tolerance_%: 1%; Res_ohm: 0; LatestRevisionDate: 2017-03-09; PartNumber: RMCF0603ZT0R00; ComponentLink1Description: Datasheet link; AEC Grade: 0; Supplier Part Number 1: RMCF0603ZT0R00CT-ND; Technology: Thick Film; ComponentLink1URL: https://www.seielect.com/Catalog/SEI-RMCF_RMCP.pdf; DesignItemID: CMP-0023343-3; LibraryName: Altium Vault - TI; FootprintName: 0603S
TP1 = CMP-0055147-2: Test Point, Multipurpose, Red, TH; Manufacturer: Keystone Electronics; CNHeader: FALSE; Green_Lifecycle: Active; Green_REACh: Passed; ContactFinish: Silver; CT: TRUE; UniqueId: 4726d92b84fba278; AddInBom: yes; OriginModelName: Keystone_5010; Device: CMP-0055147-2; Symbol: CMP-0055147-2; ComponentLink1URL: http://www.keyelco.com/userAssets/file/M60-2p60.pdf; Supplier Part Number 2: 534-5010; Publisher: Texas Instruments; Supplier 2: Mouser; Color: Red; RoHS: Y; MountType: TH; Green_EU RoHS-2: Incomplete; Supplier 1: Digi-Key; Green_EU RoHS: Passed; PackageReference: Red Multipurpose Testpoint; CompType: Test Point; LatestRevisionDate: 26/05/2017; PartNumber: 5010; ComponentLink1Description: Datasheet URL; Supplier Part Number 1: 36-5010-ND; DesignItemID: CMP-0055147-2; LibraryName: Altium Vault - TI; FootprintName: Keystone5010
TP2 = CMP-0055150-2: Test Point, Multipurpose, Orange, TH; Manufacturer: Keystone Electronics; CNHeader: FALSE; Green_Lifecycle: Active; Green_REACh: Passed; ContactFinish: Silver; CT: TRUE; UniqueId: 21ffbae72f4f4154; AddInBom: yes; OriginModelName: Keystone_5013; Device: CMP-0055150-2; Symbol: CMP-0055150-2; ComponentLink1URL: http://www.keyelco.com/userAssets/file/M60-2p60.pdf; Supplier Part Number 2: 534-5013; Publisher: Texas Instruments; Supplier 2: Mouser; Color: Orange; RoHS: Y; MountType: TH; Green_EU RoHS-2: Incomplete; Supplier 1: Digi-Key; Green_EU RoHS: Passed; PackageReference: Orange Multipurpose Testpoint; CompType: Test Point; LatestRevisionDate: 26/05/2017; PartNumber: 5013; ComponentLink1Description: Datasheet URL; Supplier Part Number 1: 36-5013-ND; DesignItemID: CMP-0055150-2; LibraryName: Altium Vault - TI; FootprintName: Keystone5013
TP3 = CMP-0055148-2: Test Point, Multipurpose, Black, TH; Manufacturer: Keystone Electronics; CNHeader: FALSE; Green_Lifecycle: Active; Green_REACh: Passed; ContactFinish: Silver; CT: TRUE; UniqueId: 8df4c48c9acaaf69; AddInBom: yes; OriginModelName: Keystone_5011; Device: CMP-0055148-2; Symbol: CMP-0055148-2; ComponentLink1URL: http://www.keyelco.com/userAssets/file/M60-2p60.pdf; Supplier Part Number 2: 534-5011; Publisher: Texas Instruments; Supplier 2: Mouser; Color: Black; RoHS: Y; MountType: TH; Green_EU RoHS-2: Incomplete; Supplier 1: Digi-Key; Green_EU RoHS: Passed; PackageReference: Black Multipurpose Testpoint; CompType: Test Point; LatestRevisionDate: 26/05/2017; PartNumber: 5011; ComponentLink1Description: Datasheet URL; Supplier Part Number 1: 36-5011-ND; DesignItemID: CMP-0055148-2; LibraryName: Altium Vault - TI; FootprintName: Keystone5011
TP4 = CMP-0055148-2: Test Point, Multipurpose, Black, TH; Manufacturer: Keystone Electronics; CNHeader: FALSE; Green_Lifecycle: Active; Green_REACh: Passed; ContactFinish: Silver; CT: TRUE; UniqueId: 6410be24ff53b3b6; AddInBom: yes; OriginModelName: Keystone_5011; Device: CMP-0055148-2; Symbol: CMP-0055148-2; ComponentLink1URL: http://www.keyelco.com/userAssets/file/M60-2p60.pdf; Supplier Part Number 2: 534-5011; Publisher: Texas Instruments; Supplier 2: Mouser; Color: Black; RoHS: Y; MountType: TH; Green_EU RoHS-2: Incomplete; Supplier 1: Digi-Key; Green_EU RoHS: Passed; PackageReference: Black Multipurpose Testpoint; CompType: Test Point; LatestRevisionDate: 26/05/2017; PartNumber: 5011; ComponentLink1Description: Datasheet URL; Supplier Part Number 1: 36-5011-ND; DesignItemID: CMP-0055148-2; LibraryName: Altium Vault - TI; FootprintName: Keystone5011
TP5 = CMP-0055149-2: Test Point, Multipurpose, White, TH; Manufacturer: Keystone Electronics; CNHeader: FALSE; Green_Lifecycle: Active; Green_REACh: Passed; ContactFinish: Silver; CT: TRUE; UniqueId: f7ec211fb22f3ea3; AddInBom: yes; OriginModelName: Keystone_5012; Device: CMP-0055149-2; Symbol: CMP-0055149-2; ComponentLink1URL: http://www.keyelco.com/userAssets/file/M60-2p60.pdf; Supplier Part Number 2: 534-5012; Publisher: Texas Instruments; Supplier 2: Mouser; Color: White; RoHS: Y; MountType: TH; Green_EU RoHS-2: Incomplete; Supplier 1: Digi-Key; Green_EU RoHS: Passed; PackageReference: White Multipurpose Testpoint; CompType: Test Point; LatestRevisionDate: 26/05/2017; PartNumber: 5012; ComponentLink1Description: Datasheet URL; Supplier Part Number 1: 36-5012-ND; DesignItemID: CMP-0055149-2; LibraryName: Altium Vault - TI; FootprintName: Keystone5012
TP6 = CMP-0055149-2: Test Point, Multipurpose, White, TH; Manufacturer: Keystone Electronics; CNHeader: FALSE; Green_Lifecycle: Active; Green_REACh: Passed; ContactFinish: Silver; CT: TRUE; UniqueId: 84aa4de12bc2747c; AddInBom: yes; OriginModelName: Keystone_5012; Device: CMP-0055149-2; Symbol: CMP-0055149-2; ComponentLink1URL: http://www.keyelco.com/userAssets/file/M60-2p60.pdf; Supplier Part Number 2: 534-5012; Publisher: Texas Instruments; Supplier 2: Mouser; Color: White; RoHS: Y; MountType: TH; Green_EU RoHS-2: Incomplete; Supplier 1: Digi-Key; Green_EU RoHS: Passed; PackageReference: White Multipurpose Testpoint; CompType: Test Point; LatestRevisionDate: 26/05/2017; PartNumber: 5012; ComponentLink1Description: Datasheet URL; Supplier Part Number 1: 36-5012-ND; DesignItemID: CMP-0055149-2; LibraryName: Altium Vault - TI; FootprintName: Keystone5012
TP7 = CMP-0055159-2: Test Point, Multipurpose, Grey, TH; Manufacturer: Keystone Electronics; CNHeader: FALSE; Green_Lifecycle: Active; Green_REACh: Passed; ContactFinish: Silver; CT: TRUE; UniqueId: 7a581efd1dfccb02; AddInBom: yes; OriginModelName: Keystone_5128; Device: CMP-0055159-2; Symbol: CMP-0055159-2; ComponentLink1URL: http://www.keyelco.com/userAssets/file/M60-2p60.pdf; Supplier Part Number 2: 95M2500; Publisher: Texas Instruments; Supplier 2: Newark; Supplier Part Number 3: 534-5128; Color: Grey; Supplier 3: Mouser; RoHS: Y; MountType: TH; Green_EU RoHS-2: Incomplete; Supplier 1: Digi-Key; Green_EU RoHS: Passed; PackageReference: Grey Multipurpose Testpoint; CompType: Test Point; LatestRevisionDate: 26/05/2017; PartNumber: 5128; ComponentLink1Description: Datasheet URL; Supplier Part Number 1: 36-5128-ND; DesignItemID: CMP-0055159-2; LibraryName: Altium Vault - TI; FootprintName: Keystone5128
TP8 = CMP-0055150-2: Test Point, Multipurpose, Orange, TH; Manufacturer: Keystone Electronics; CNHeader: FALSE; Green_Lifecycle: Active; Green_REACh: Passed; ContactFinish: Silver; CT: TRUE; UniqueId: 375a2f0a72128209; AddInBom: yes; OriginModelName: Keystone_5013; Device: CMP-0055150-2; Symbol: CMP-0055150-2; ComponentLink1URL: http://www.keyelco.com/userAssets/file/M60-2p60.pdf; Supplier Part Number 2: 534-5013; Publisher: Texas Instruments; Supplier 2: Mouser; Color: Orange; RoHS: Y; MountType: TH; Green_EU RoHS-2: Incomplete; Supplier 1: Digi-Key; Green_EU RoHS: Passed; PackageReference: Orange Multipurpose Testpoint; CompType: Test Point; LatestRevisionDate: 26/05/2017; PartNumber: 5013; ComponentLink1Description: Datasheet URL; Supplier Part Number 1: 36-5013-ND; DesignItemID: CMP-0055150-2; LibraryName: Altium Vault - TI; FootprintName: Keystone5013
U1 = CMP-0094661-2: Wide VIN Bidirectional 4 Switch Buck-Boost Controller; Manufacturer: Texas Instruments; Manufacturer Lifecycle Status: ACTIVE; Output Voltage: 3.3-78V; Max Supply Voltage: 78V; AEC Qualified: No; SizeZ_mm: 1.2mm; Switching Frequency: 100-2000kHz; AEC Category: Q200; Number Of Outputs: 2; Min Supply Voltage: 2.8V; Output Type: AdjustableProgrammable; Max Duty Cycle: 100%; CompType: IC; Standoff Height: 0.05mm; Nominal Supply Current: 25uA; TJmax_C: +125癈; Origin Footprint: DCP0038A-IPC_C; OriginFootprint 2: DCP0038A-IPC_B; OriginFootprint 3: DCP0038A-IPC_A; UniqueId: 1bdc0ab44f99f92d; AddInBom: yes; OriginModelName: IC_LM5177DCPR_HTSSOP38; Device: CMP-0094661-2; Symbol: CMP-0094661-2; ComponentLink2Description: Product Folder; PartNumber: LM5177DCPR; Operating Temperature Range: -40癈 to +125癈; Part Number: LM5177DCPR; ComponentLink3URL: http://www.ti.com/product/GPN/datasheet; ComponentLink1URL: http://www.ti.com/lit/ds/symlink/GPN.pdf; RoHS: UNKNOWN; ComponentLink3Description: Online Datasheet; ComponentLink1Description: Datasheet Link; Switching Topology: Buck-Boost; ComponentLink2URL: http://www.ti.com/product/GPN; Datasheet Path: datasheets/IC-LM5177DCPR.pdf; helpURL: https://upverter.com/upn/revision/d4783a621c1931dd/; PackageReference: HTSSOP38; DesignItemID: CMP-0094661-2; LibraryName: Altium Vault - TI; FootprintName: DCP0038A-MFG; Supplier 1: Mouser; Manufacturer Part Number: LM5177DCPR; Stock 1: 741; Pricing 1: 1=8.46, 10=6.55, 50=6.08, 100=5.55, 1000=5.42, 10000=4.6 (USD); Height: 1.2mm; Length: 9.7mm; Lifecycle Status: Production; Number of Pins: 38; Thickness: 1.15mm; Topology: Buck-Boost; Width: 4.4mm; ComponentLink4URL: https://sigma.octopart.com:443/150835829/technical_drawing/Texas-Instruments-LM5177DCPR.pdf?src-supplier=Texas+Instruments; ComponentLink4Description: https://sigma.octopart.com:443/150835829/technical_drawing/Texas-Instruments-LM5177DCPR.pdf?src-supplier=Texas+Instruments; ComponentLink5URL: https://octopart.com:443/opatz8j6/c1?t=2meVI9Ys0v26m6bGgLUs4HyxqDgUi_PdijUQkLRB7X3oIMPJ_2DwIqJBGNM9bLa65FmSJmDfBBHzW_XgTEo_27W85jUwvA41jdc23-HisQNZRYaAw8K-zZISmAQrU3bxfEjix9O-NAgtvU4A5AwwDONWmssYZYy-blMv1qKAk4-AKD6qt0hPy3dOUHQAGBQfd-QqZL0d02my4YO46Ni3ATYEmeA6-_BjLvvyW2wXtOpBI_TaTwFyIkmihkdWQNB7lh0T8UMKem9CuUww2GwlSvoQ313VuhdoUvOroaEBkTowtT-WEqcS3g7wEAlf5_jWm8VZvGHioz5-o2QYiqOAEg4vGEjUpPa72dceAeX_PxWG8WqZKv51mQleYH2pctfMbjZwhw&src-supplier=Texas+Instruments; ComponentLink5Description: https://octopart.com:443/opatz8j6/c1?t=2meVI9Ys0v26m6bGgLUs4HyxqDgUi_PdijUQkLRB7X3oIMPJ_2DwIqJBGNM9bLa65FmSJmDfBBHzW_XgTEo_27W85jUwvA41jdc23-HisQNZRYaAw8K-zZISmAQrU3bxfEjix9O-NAgtvU4A5AwwDONWmssYZYy-blMv1qKAk4-AKD6qt0hPy3dOUHQAGBQfd-QqZL0d02my4YO46Ni3ATYEmeA6-_BjLvvyW2wXtOpBI_TaTwFyIkmihkdWQNB7lh0T8UMKem9CuUww2GwlSvoQ313VuhdoUvOroaEBkTowtT-WEqcS3g7wEAlf5_jWm8VZvGHioz5-o2QYiqOAEg4vGEjUpPa72dceAeX_PxWG8WqZKv51mQleYH2pctfMbjZwhw&src-supplier=Texas+Instruments; ComponentLink6URL: http://sigma.octopart.com:80/reach_statement/Texas-Instruments-company-64.pdf?src-supplier=Compliance+Statements; ComponentLink6Description: http://sigma.octopart.com:80/reach_statement/Texas-Instruments-company-64.pdf?src-supplier=Compliance+Statements; ComponentLink7URL: http://sigma.octopart.com:80/conflict_mineral_statement/Texas-Instruments-company-63.pdf?src-supplier=Compliance+Statements; ComponentLink7Description: http://sigma.octopart.com:80/conflict_mineral_statement/Texas-Instruments-company-63.pdf?src-supplier=Compliance+Statements